# Altium project LiFePo4 USB-C BQ24630.PrjPcb
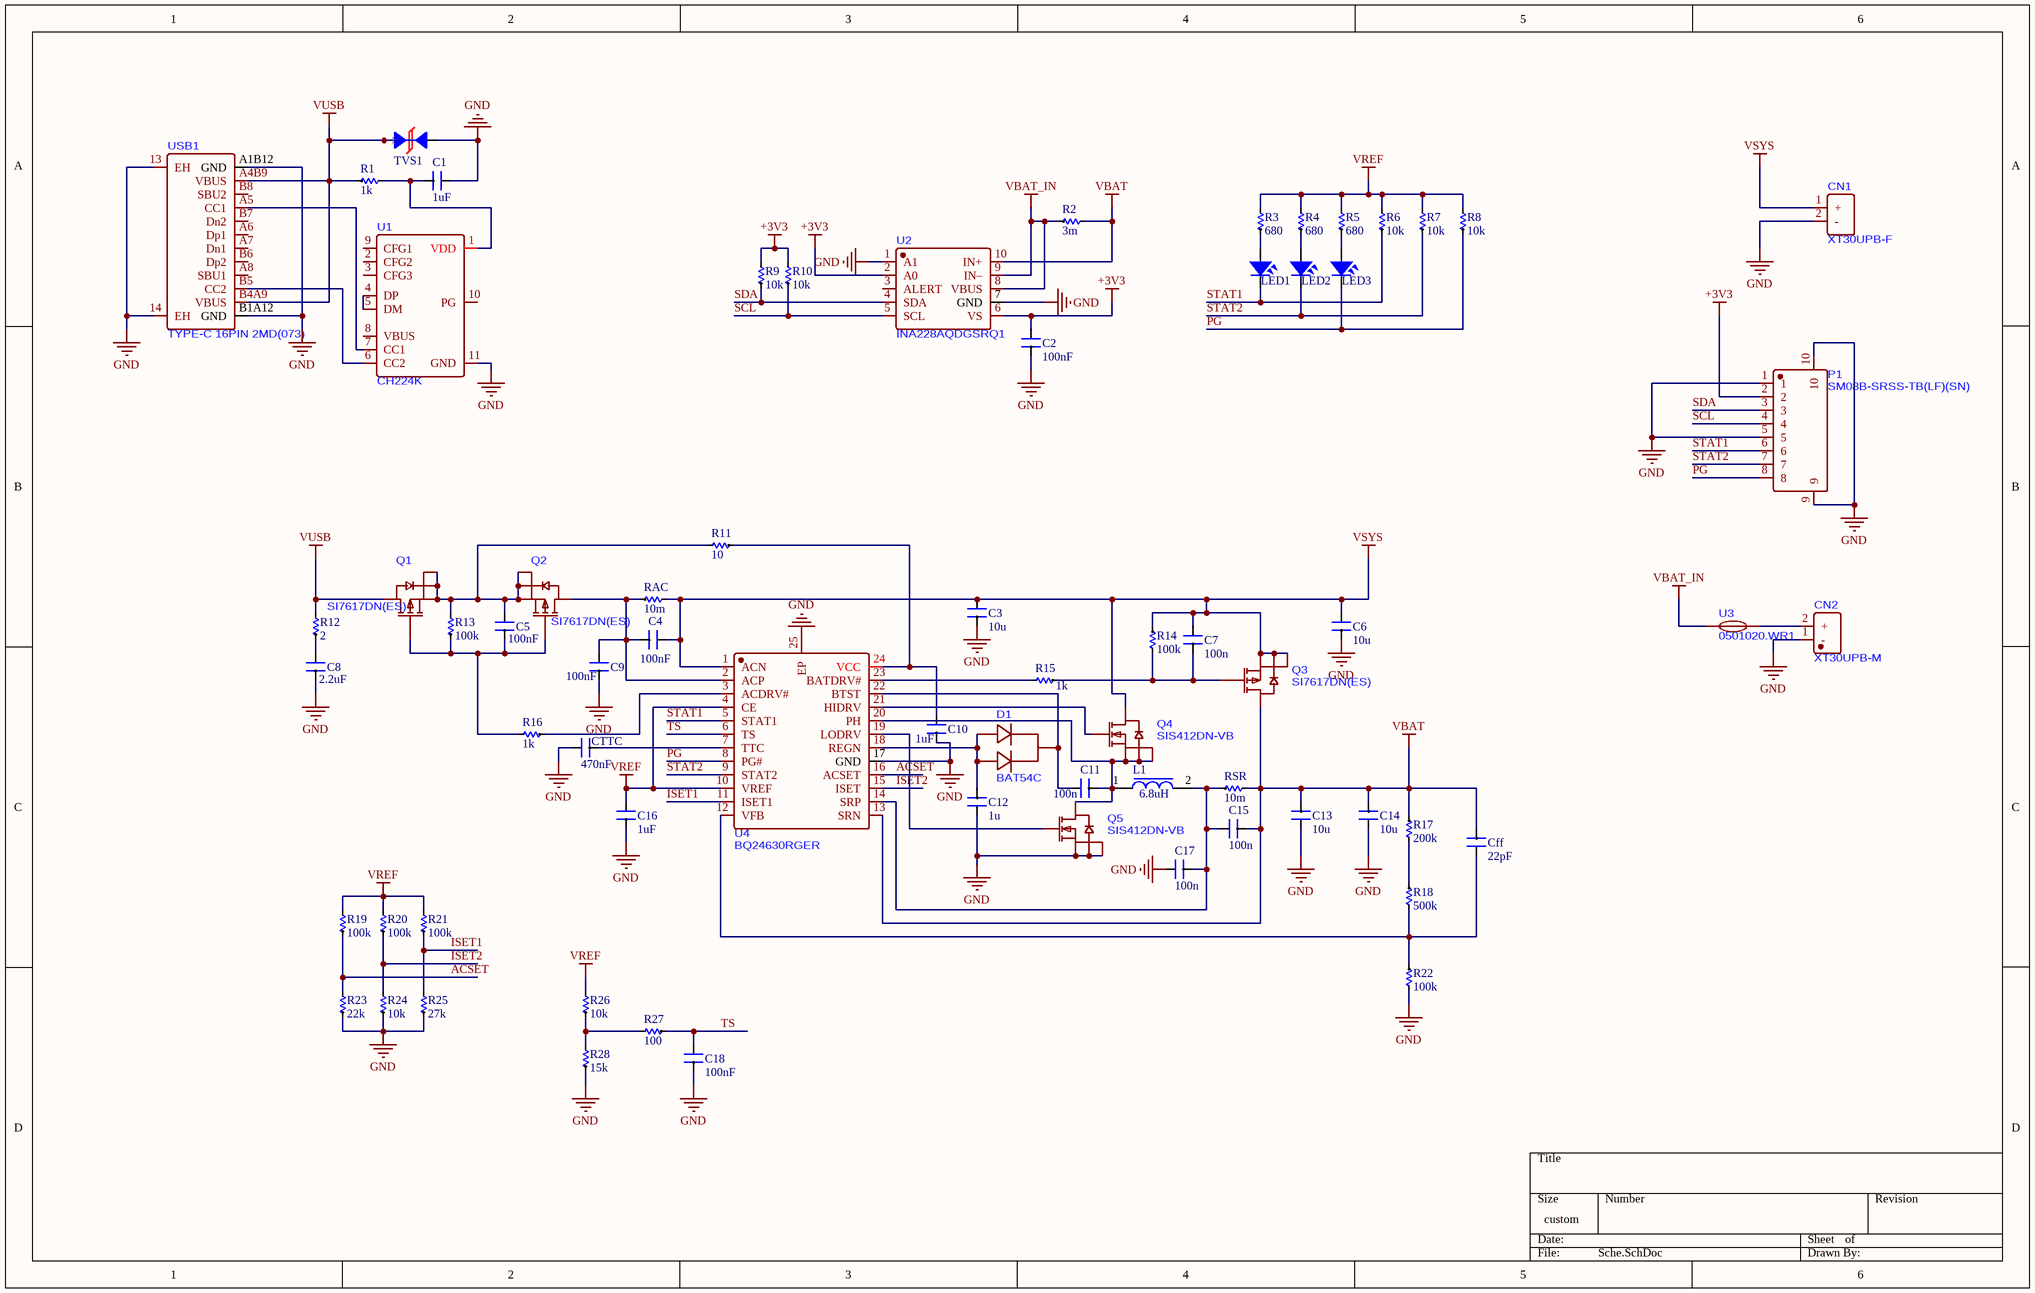
[diagram p0: Sche.SchDoc]
1 sheet, 69 parts. Net scope: global (net labels, ports and power ports of the same name join across sheets).
Board file: PCB1.PcbDoc

## Sheet Sche.SchDoc
size 381 x 241 mm; SheetNumber: 1; SheetTotal: 1

### Parts
C1  1uF  [CAP-SMD-0805]
C2  100nF  [CAP-SMD-0805]
C3  10u  [CAP-SMD-1206]
C4  100nF  [CAP-SMD-0805]
C5  100nF  [CAP-SMD-0805]
C6  10u  [CAP-SMD-0805]
C7  100n  [CAP-SMD-0805]
C8  2.2uF  [CAP-SMD-0805]
C9  100nF  [CAP-SMD-0805]
C10  1uF  [CAP-SMD-0805]
C11  100n  [CAP-SMD-0805]
C12  1u  [CAP-SMD-0805]
C13  10u  [CAP-SMD-0805]
C14  10u  [CAP-SMD-0805]
C15  100n  [CAP-SMD-0805]
C16  1uF  [CAP-SMD-0805]
C17  100n  [CAP-SMD-0805]
C18  100nF  [CAP-SMD-0805]
Cff  22pF  [CAP-SMD-0805]
CN1  XT30UPB-F  [CONN-TH_XT30UPB-F]
CN2  XT30UPB-M  [CONN-TH_XT30UPB-M]
CTTC  470nF  [CAP-SMD-0805]
D1  BAT54C  [SOT-23-3_L2.9-W1.6-P1.90-LS2.8-BR]
L1  6.8uH  [L-SMD-M-8x8mm]
LED1  LED  [LED-0805-Green]  (value not drawn)
LED2  LED  [LED-0805-Red]  (value not drawn)
LED3  LED  [LED-0805-Green]  (value not drawn)
P1  SM08B-SRSS-TB(LF)(SN)  [CONN-TH_SM08B-SRSS-TB-LF-SN]
Q1  SI7617DN(ES)  [DFN-8_L3.3-W3.3-P0.65-BL]
Q2  SI7617DN(ES)  [DFN-8_L3.3-W3.3-P0.65-BL]
Q3  SI7617DN(ES)  [DFN-8_L3.3-W3.3-P0.65-BL]
Q4  SIS412DN-VB  [POWERPAK-1212-8_L3.0-W3.0-P0.65-LS3.3-BL]
Q5  SIS412DN-VB  [POWERPAK-1212-8_L3.0-W3.0-P0.65-LS3.3-BL]
R1  1k  [RES-SMD-2010]
R2  3m  [RES-SMD-2512]
R3  680  [RES-SMD-0805]
R4  680  [RES-SMD-0805]
R5  680  [RES-SMD-0805]
R6  10k  [RES-SMD-0805]
R7  10k  [RES-SMD-0805]
R8  10k  [RES-SMD-0805]
R9  10k  [RES-SMD-0805]
R10  10k  [RES-SMD-0805]
R11  10  [RES-SMD-0805]
R12  2  [RES-SMD-2512]
R13  100k  [RES-SMD-0805]
R14  100k  [RES-SMD-0805]
R15  1k  [RES-SMD-0805]
R16  1k  [RES-SMD-0805]
R17  200k  [RES-SMD-0805]
R18  500k  [RES-SMD-0805]
R19  100k  [RES-SMD-0805]
R20  100k  [RES-SMD-0805]
R21  100k  [RES-SMD-0805]
R22  100k  [RES-SMD-0805]
R23  22k  [RES-SMD-0805]
R24  10k  [RES-SMD-0805]
R25  27k  [RES-SMD-0805]
R26  10k  [RES-SMD-0805]
R27  100  [RES-SMD-0805]
R28  15k  [RES-SMD-0805]
RAC  10m  [RES-SMD-1206]
RSR  10m  [RES-SMD-1206]
TVS1  DIODE TVS  [SMB]  (value not drawn)
U1  CH224K  [ESSOP-10_L4.9-W3.9-P1.0-LS6.0-TL-EP]
U2  INA228AQDGSRQ1  [VSSOP-10_L3.0-W3.0-P0.50-LS4.9-BL]
U3  0501020.WR1  [F1206]
U4  BQ24630RGER  [QFN-24_L4.0-W4.0-P0.50-BL-EP2.5]
USB1  TYPE-C 16PIN 2MD(073)  [USB-C-SMD_TYPE-C-16PIN-2MD-073]

### Nets
+3V3: C2.2 P1.2 R9.1 R10.1 U2.2(A0) U2.6(VS)
GND: C1.2 C2.1 C3.1 C6.1 C8.1 C9.1 C10.1 C12.2 C13.2 C14.2 C16.1 C17.2 C18.1 CN1.2(-) CN2.1(-) CTTC.2 P1.1 P1.5 P1.9 P1.10 Q5.1(S) Q5.2(S) Q5.3(S) R22.1 R23.2 R24.2 R25.2 R28.2 TVS1.2 U1.11(GND) U2.1(A1) U2.7(GND) U4.17(GND) U4.25(EP) USB1.13(EH) USB1.14(EH) USB1.A1B12(GND) USB1.B1A12(GND)
VBAT: C13.1 C14.1 C15.1 Cff.1 Q3.5(D) R2.1 R17.2 RSR.1 U2.10(IN+) U4.13(SRN)
VBAT_IN: R2.2 U2.8(VBUS) U2.9(IN–) U3.1
VREF: C16.2 R3.1 R4.1 R5.1 R6.1 R7.1 R8.1 R19.1 R20.1 R21.1 R26.1 U4.4(CE) U4.10(VREF)
VSYS: C3.2 C4.2 C6.2 C7.2 CN1.1(+) Q3.1(S) Q3.2(S) Q3.3(S) Q4.5(D) R14.2 RAC.1 U4.1(ACN)
VUSB: Q1.5(D) R1.2 R12.1 TVS1.1 USB1.A4B9(VBUS) USB1.B4A9(VBUS)
ACSET: R19.2 R23.1 U4.16(ACSET)
ISET1: R21.2 R25.1 U4.11(ISET1)
ISET2: R20.2 R24.1 U4.15(ISET)
PG: LED3.2 P1.8 R8.2 U4.8(PG#)
SCL: P1.4 R10.2 U2.5(SCL)
SDA: P1.3 R9.2 U2.4(SDA)
STAT1: LED1.2 P1.6 R6.2 U4.5(STAT1)
STAT2: LED2.2 P1.7 R7.2 U4.9(STAT2)
TS: C18.2 R27.2 U4.6(TS)
NetC1_1: C1.1 R1.1 U1.1(VDD)
NetC4_1: C4.1 C9.2 Q2.5(D) RAC.2 U4.2(ACP)
NetC5_1: C5.1 Q1.4(G) Q2.4(G) R13.2 R16.1
NetC5_2: C5.2 Q1.1(S) Q1.2(S) Q1.3(S) Q2.1(S) Q2.2(S) Q2.3(S) R11.1 R13.1
NetC7_1: C7.1 Q3.4(G) R14.1 R15.2
NetC8_2: C8.2 R12.2
NetC10_2: C10.2 R11.2 U4.24(VCC)
NetC11_1: C11.1 L1.1 Q4.1(S) Q4.2(S) Q4.3(S) Q5.5(D) U4.20(PH)
NetC11_2: C11.2 D1.3(K) U4.22(BTST)
NetC12_1: C12.1 D1.1(A1) D1.2(A2) U4.18(REGN)
NetC15_2: C15.2 C17.1 L1.2 RSR.2 U4.14(SRP)
NetCff_2: Cff.2 R18.1 R22.2 U4.12(VFB)
NetCN2_2: CN2.2(+) U3.2
NetCTTC_1: CTTC.1 U4.7(TTC)
NetLED1_1: LED1.1 R3.2
NetLED2_1: LED2.1 R4.2
NetLED3_1: LED3.1 R5.2
NetQ4_4: Q4.4(G) U4.21(HIDRV)
NetQ5_4: Q5.4(G) U4.19(LODRV)
NetR15_1: R15.1 U4.23(BATDRV#)
NetR16_2: R16.2 U4.3(ACDRV#)
NetR17_1: R17.1 R18.2
NetR26_2: R26.2 R27.1 R28.1
NetU1_4: U1.4(DP) U1.5(DM)
NetU1_6: U1.6(CC2) USB1.B5(CC2)
NetU1_7: U1.7(CC1) USB1.A5(CC1)

Not connected (* = marked no-connect by the designer): U1 2(CFG2) 3(CFG3) 8(VBUS) 9(CFG1) 10(PG); U2 3(ALERT); USB1 A6(Dp1) A7(Dn1) A8(SBU1) B6(Dp2) B7(Dn2) B8(SBU2)

### Library data of the parts
C1-C18 Cff CTTC = CAP-SMD: Value: 33pF
L1 = L-SMD-1: partNo: 78477010; Manufacturer: Wurth Elektronik; Inductance: 1.0 μH; ComponentLink1Description: Manufacturer; ComponentLink1URL: http://www.we-online.de; Created by: Baojun Chen; Created Date: Nov.2015; ComponentLink2Description: Datasheet; ComponentLink2URL: http://katalog.we-online.de/pbs/datasheet/78477010.pdf
LED1-LED3 = LED1-SMD: Value: LED 3 - 5 ly 2 Colour
R1-R28 RAC RSR = Res-SMD: Resistor; Manufacturer: Generic Components; Class: Passive; Published: 08/06/2000; Publisher: Altium Hobart Technology Centre
TVS1 = DIODE TVS: TVS